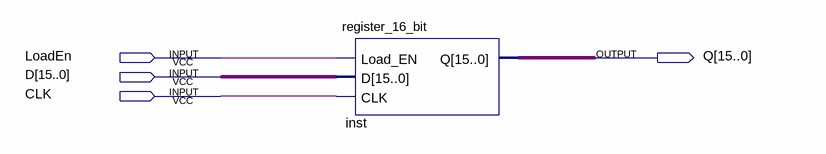
[diagram p0: schematic sheet]
// Quartus schematic test_register.bdf as structural Verilog: 1 symbols, 4 pins
module test_register (
  input  LoadEn,
  input  [15:0] D,
  input  CLK,
  output [15:0] Q
);

  register_16_bit inst (.Load_EN(LoadEn), .D(D), .CLK(CLK), .Q(Q));
endmodule
